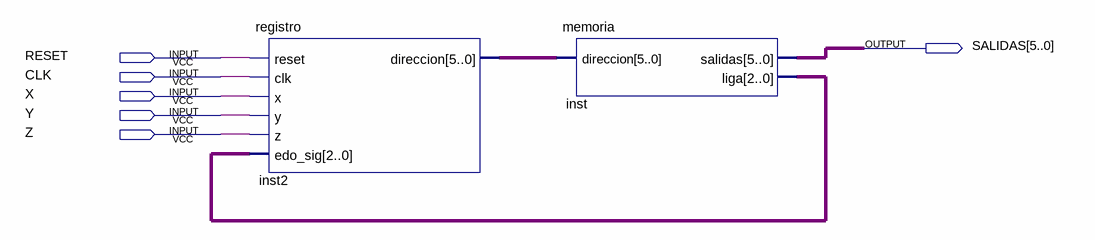
[diagram p0: schematic sheet]
// Quartus schematic Practica_03.bdf as structural Verilog: 2 symbols, 6 pins
module Practica_03 (
  input  RESET,
  input  CLK,
  input  X,
  input  Y,
  input  Z,
  output [5:0] SALIDAS
);

  wire [2:0] inst_liga;
  wire [5:0] inst2_direccion;

  registro inst2 (.reset(RESET), .clk(CLK), .x(X), .y(Y), .z(Z), .edo_sig(inst_liga), .direccion(inst2_direccion));
  memoria inst (.direccion(inst2_direccion), .salidas(SALIDAS), .liga(inst_liga));
endmodule
